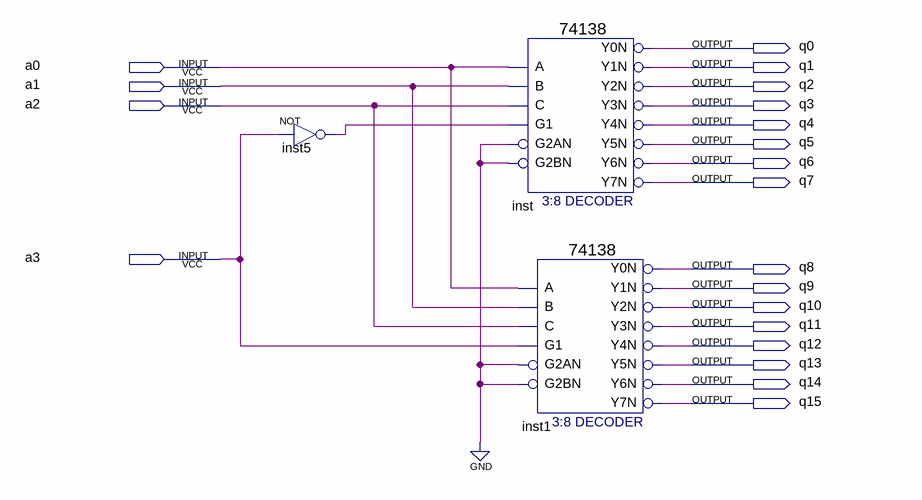
[diagram p0: schematic sheet]
// Quartus schematic 4to16.bdf as structural Verilog: 3 symbols, 20 pins
module \4to16  (
  input  a0,
  input  a1,
  input  a2,
  input  a3,
  output q0,
  output q1,
  output q2,
  output q3,
  output q4,
  output q5,
  output q6,
  output q7,
  output q8,
  output q9,
  output q10,
  output q11,
  output q12,
  output q13,
  output q14,
  output q15
);

  wire inst5_out;

  not inst5 (inst5_out, a3);
  \74138  inst (
    .A(a0), .B(a1), .G1(inst5_out), .C(a2), .G2AN(1'b0), .G2BN(1'b0), .Y0N(q0), .Y1N(q1), .Y2N(q2), .Y3N(q3),
    .Y4N(q4), .Y5N(q5), .Y6N(q6), .Y7N(q7));
  \74138  inst1 (
    .A(a0), .B(a1), .G1(a3), .C(a2), .G2AN(1'b0), .G2BN(1'b0), .Y0N(q8), .Y1N(q9), .Y2N(q10), .Y3N(q11),
    .Y4N(q12), .Y5N(q13), .Y6N(q14), .Y7N(q15));
endmodule
